# EasyEDA Pro project 电脑鼠_数字量最终方案.eprj, schematic 扩展主板
Create Date: 2025-09-23; Page Name: P1; Project Name: 电脑鼠SYR; Schematic Name: 扩展主板; Update Date: 2025-10-13; Company: 苏州大学电子信息学院; Drawed: 石殷睿; Page Size: A4; Version: V1.0
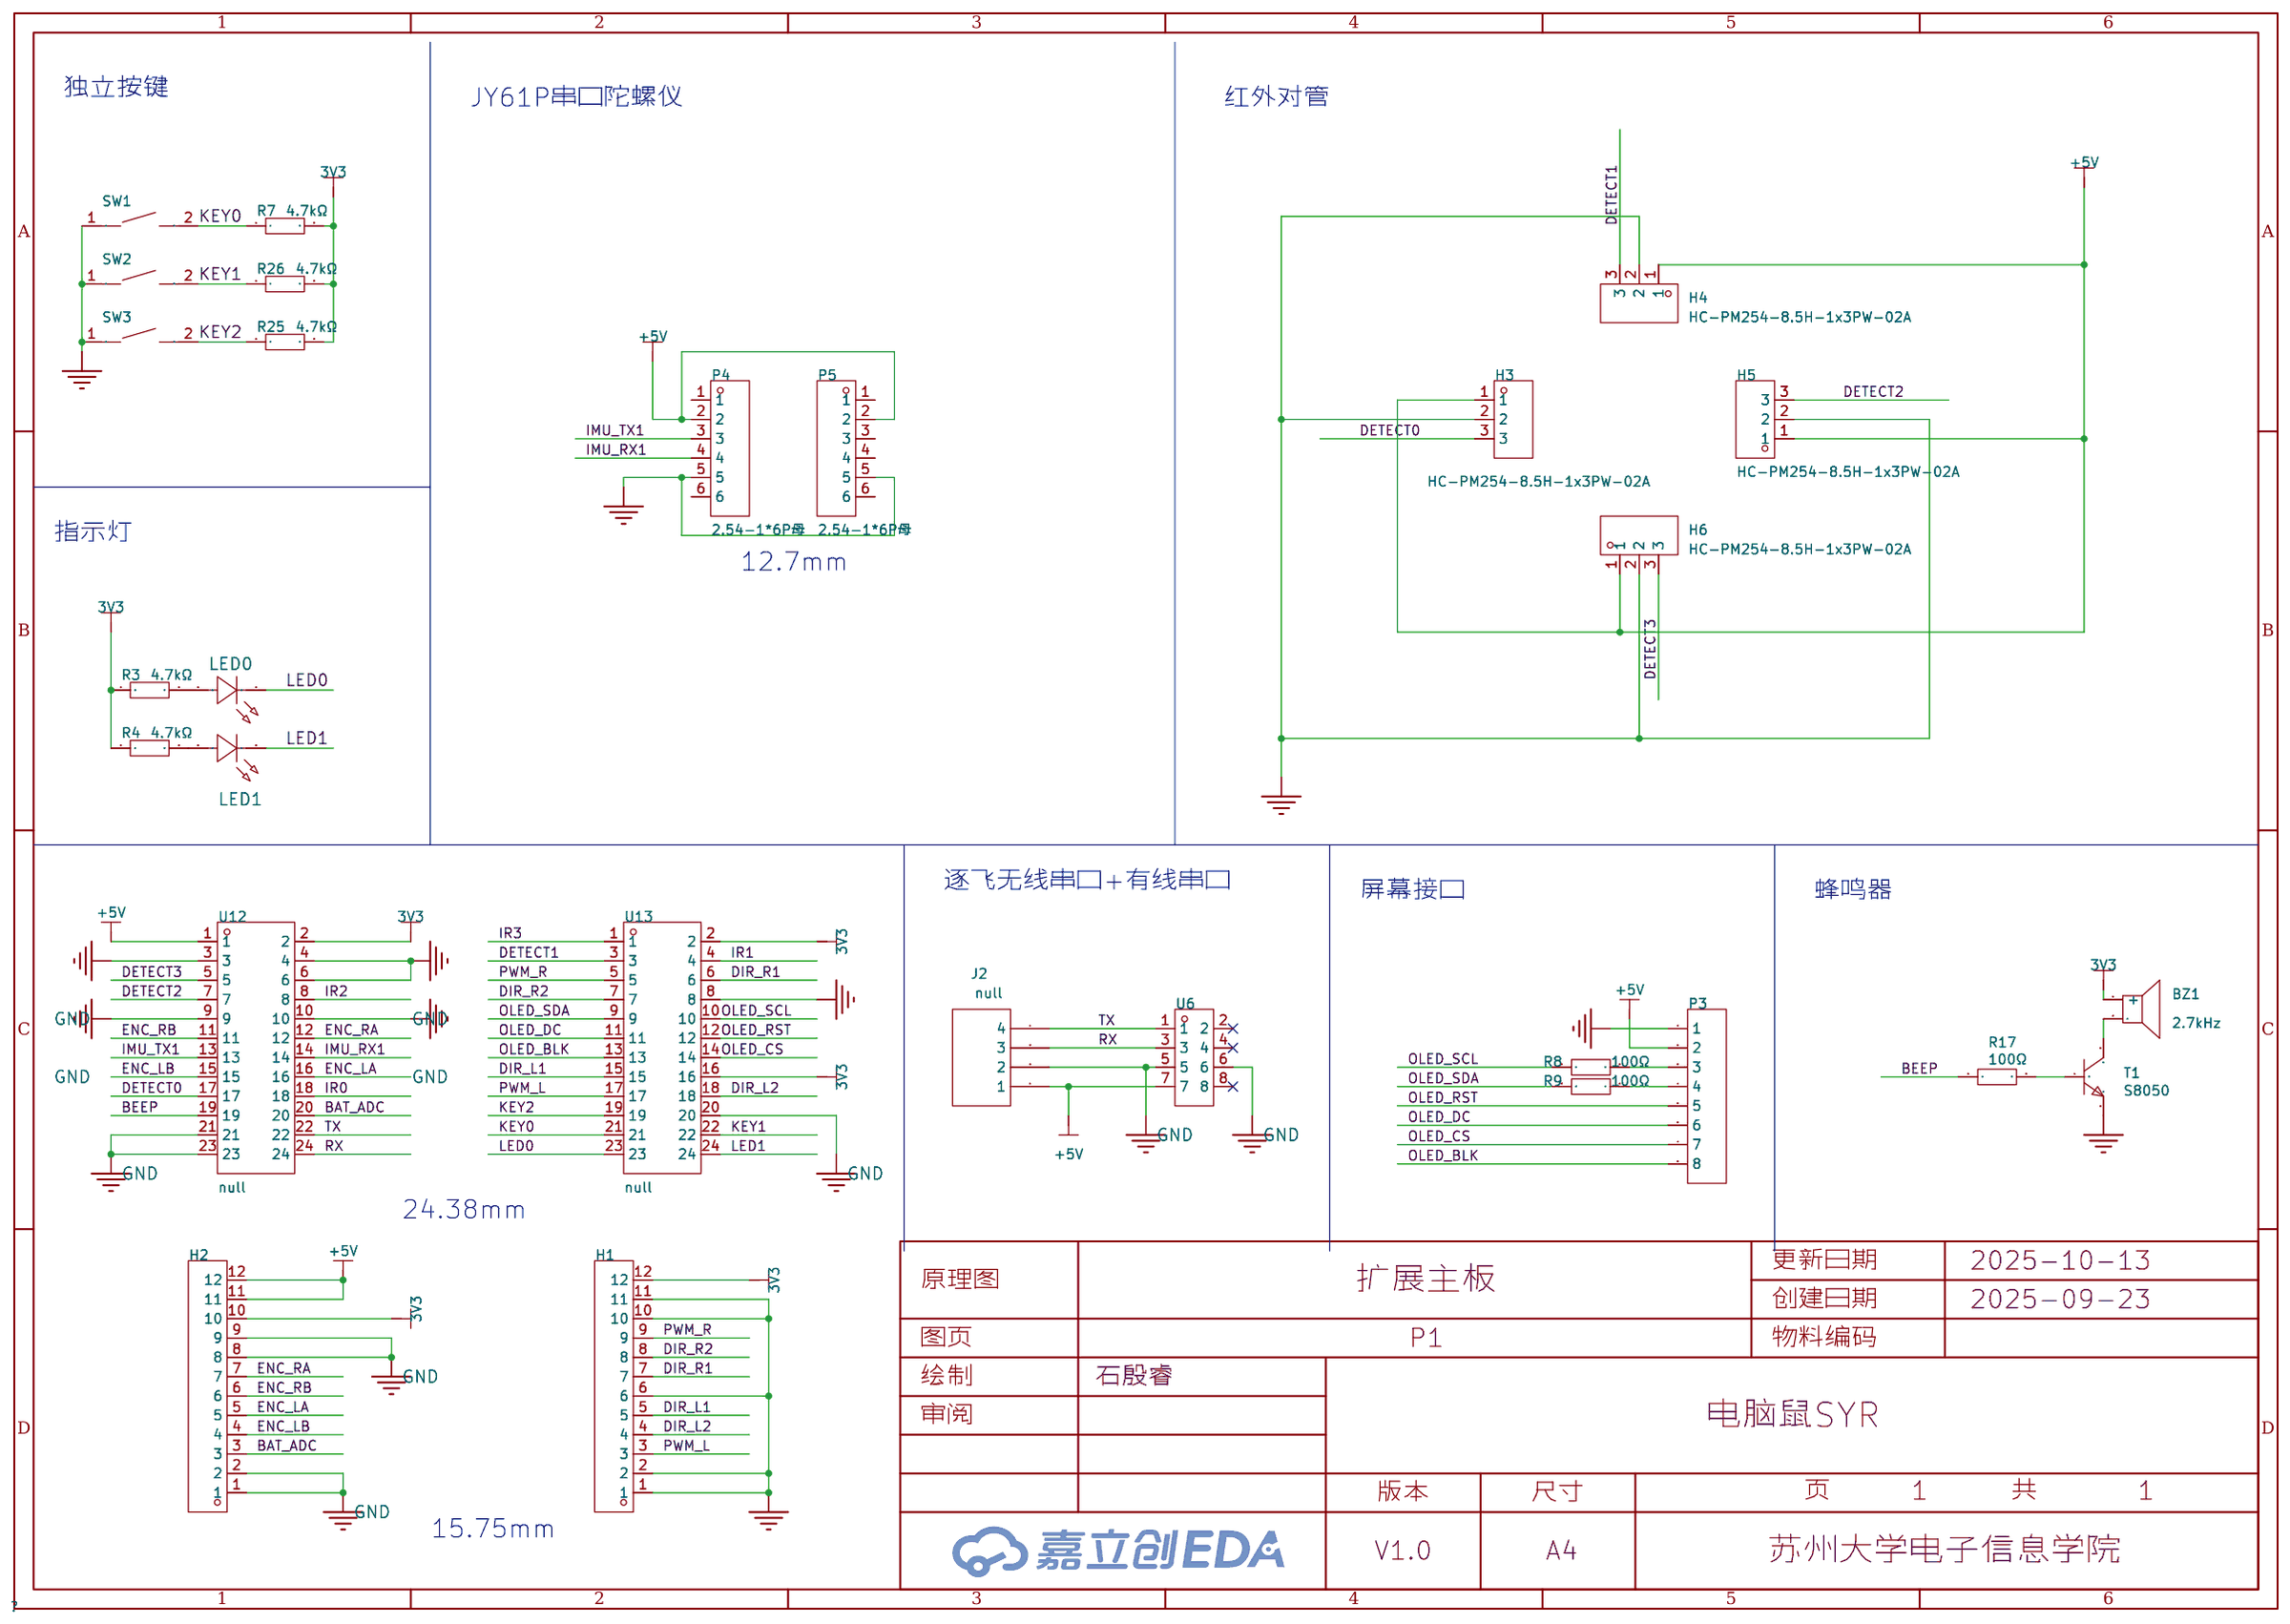
[diagram p0: schematic sheet]

## Parts
BZ1  2.7kHz  [BUZ-TH_BD12.0-P7.60-D0.6-FD]
H1  -  [HDR-TH_12P-P2.54-V-M]
H2  -  [HDR-TH_12P-P2.54-V-M]
H3  HC-PM254-8.5H-1x3PW-02A  [HDR-TH_3P-P2.54_HC-PM254-8.5H-1X3PW]
H4  HC-PM254-8.5H-1x3PW-02A  [HDR-TH_3P-P2.54_HC-PM254-8.5H-1X3PW]
H5  HC-PM254-8.5H-1x3PW-02A  [HDR-TH_3P-P2.54_HC-PM254-8.5H-1X3PW]
H6  HC-PM254-8.5H-1x3PW-02A  [HDR-TH_3P-P2.54_HC-PM254-8.5H-1X3PW]
J2  null  [HEADER1X4]
LED0  XL-1608SURC-06  [LED0603-RD_RED]
LED1  XL-1608SURC-06  [LED0603-RD_RED]
P3  null  [HDR-TH_8P-P2.54-V-F-1]
P4  2.54-1*6P母  [HDR-TH_6P-P2.54-V-F]
P5  2.54-1*6P母  [HDR-TH_6P-P2.54-V-F]
R3  4.7kΩ  [R0603]
R4  4.7kΩ  [R0603]
R7  4.7kΩ  [R0603]
R8  100Ω  [R0603]
R9  100Ω  [R0603]
R17  100Ω  [R0603]
R25  4.7kΩ  [R0603]
R26  4.7kΩ  [R0603]
SW1  TS-1088-AR02016  [SW-SMD_L3.9-W3.0-P4.45]
SW2  TS-1088-AR02016  [SW-SMD_L3.9-W3.0-P4.45]
SW3  TS-1088-AR02016  [SW-SMD_L3.9-W3.0-P4.45]
T1  S8050  [SOT-23-3_L2.9-W1.3-P1.90-LS2.3-BR]
U6  null  [HDR-TH_8P-P2.54-V-F-R2-C4-S2.54-1]
U12  null  [HDR-TH_24P-P2.54-V-F-R2-C12-S2.54-2]
U13  null  [HDR-TH_24P-P2.54-V-F-R2-C12-S2.54-2]

## Library data of the parts
BZ1 = SUN-12095-5VPA7.6: 驱动方式:有源(内含驱动线路);构造类型:电磁式;额定电压:-;频率:2.7kHz;声压(SPL):85dB;; LCSC Part Name: 电磁有源蜂鸣器; Supplier Part: C360615; Manufacturer: S&S(海旭); Supplier Footprint: 插件,D=12mm; JLCPCB Part Class: Extended Part; Datasheet: https://item.szlcsc.com/datasheet/SUN-12095-5VPA7.6/335364.html; Supplier: LCSC; Oscillator Circuit: 有源(内含驱动线路); Technology Type: 电磁式; Operating Voltage: 3V~7V; Sound Pressure Level (SPL): 85dB@5V,10cm; Diameter (φD): 12mm; Height: 9.8mm; Driver Circuitry: 有源(内含驱动线路); Technology: 电磁式; Voltage - Supply: 4V~7V; Sound Pressure Level(SPL): 85dB; Diameter(φD): 12mm
H1 H2 = HDR-M_2.54_1x12P: 间距:2.54mm;总PIN位数:12;排数:1;插针结构:1x12P;行距:-;安装类型:直插;圆针/方针:方针;额定电流:3A;额定电压:250V;配合针长度:6mm;塑高:2.5mm;端接针长度:3mm;触头材质:-;工作温度范围:-40℃~+105℃;颜色:黑色;; Supplier Part: C2840012; Supplier Footprint: 插件; JLCPCB Part Class: 扩展库; Check: false
H3-H6 = HC-PM254-8.5H-1x3PW-02A: 插孔结构:1x3P;间距:2.54mm;行距:-;圆孔/方孔:方孔;安装方式:弯插;排数:单排;总孔位数:3P;额定电流:3A;额定电压:-;插孔方向:侧面;塑高:2.5mm;触头材质:黄铜;触头镀层:金;工作温度:-40℃~+105℃;; LCSC Part Name: 间距2.54mm 1x3Pin 弯插 PC3.2 PB10.2 H8.5; Supplier Part: C22373927; Manufacturer: HC(虹成电子); Supplier Footprint: 弯插,P=2.54mm; JLCPCB Part Class: 扩展库; Datasheet: https://item.szlcsc.com/datasheet/HC-PM254-8.5H-1x3PW-02A/23870263.html; Supplier: LCSC; Holes Structure: 1x3P; Pitch: 2.54mm; Circular Hole / Square Hole: 方孔; Mounting Type: 弯插; Number of Rows: 单排; Number of Positions: 3P; Current Rating: 3A; Holes Direction: 侧面; Insulation Height: 2.5mm; Contact Material: 黄铜; Contact Plating: 金; Operating Temperature: -40℃~+105℃; PIN Length: 3mm
J2 = Header1x4: Check: false
LED0 LED1 = XL-1608SURC-06: 灯头类型:-;发光颜色:红色;正向压降(Vf):2.3V;功率:50mW;正向电流:20mA;波长:620nm~630nm;二极管配置:-;透镜颜色:无色透明透镜;色温:-;发光强度:225mcd;发光角度:120°;载带方式:正贴;工作温度:-40℃~+85℃;; LCSC Part Name: 0603红色贴片式发光二极管; Supplier Part: C965799; Manufacturer: XINGLIGHT(成兴光); Supplier Footprint: 0603; JLCPCB Part Class: Extended Part; Datasheet: https://item.szlcsc.com/datasheet/XL-1608SURC-06/1051408.html; Supplier: LCSC; Emitted Color: 红色; Power Dissipation: 55mW; Forward Current: 20mA; Dominant Wavelength: 617nm~621nm; Peak Wavelength: 625nm; Lens Color: 无色透明透镜; Viewing Angle: 120°; Mounting Sytle: 正贴; Operating Temperature: -40℃~+85℃; Illumination Color: 红色; Voltage - Forward(Vf): 2.3V; Power(Watts): 50mW; Wavelength - Dominant: 620nm~630nm; Luminous Intensity: 225mcd; Mounting Style: 正贴
P3 = 2.54-1*8P母环保: 插孔结构:1x8P;间距:2.54mm;行距:-;安装类型:直插;排数:单排;总孔位数:8P;塑高:-;触头材质:-;触头镀层:-;; LCSC Part Name: 间距:2.54mm 1x8P 直插; Supplier Part: C27438; Manufacturer: BOOMELE(博穆精密); Supplier Footprint: 插件,P=2.54mm; JLCPCB Part Class: 扩展库; Datasheet: https://atta.szlcsc.com/upload/public/pdf/source/20231221/1CA800C6799ED97958773716FAA1BFFE.pdf; Supplier: LCSC; Holes Structure: 1x8P; Pitch: 2.54mm; Mounting Type: 直插; Number of Rows: 单排; Number of Holes: 8P; Check: false
P4 P5 = 2.54-1*6P母: 插孔结构:1x6P;间距:2.54mm;行距:-;安装方式:直插;排数:单排;总孔位数:6P;塑高:-;触头材质:-;触头镀层:-;; LCSC Part Name: 间距:2.54mm 1x6P 直插; Supplier Part: C40877; Manufacturer: BOOMELE(博穆精密); Supplier Footprint: 插件,P=2.54mm; JLCPCB Part Class: 扩展库; Datasheet: https://item.szlcsc.com/datasheet/2.54-1*6P%25E6%25AF%258D/41861.html; Supplier: LCSC; Holes Structure: 1x6P; Pitch: 2.54mm; Mounting Type: 直插; Number of Rows: 单排; Number of Positions: 6P
R3 R4 R7 R25 R26 = 0603WAF4701T5E: 电阻类型:厚膜电阻;阻值:4.7kΩ;精度:±1%;功率:100mW;工作电压:75V;温度系数:±100ppm/℃;; LCSC Part Name: 4.7kΩ ±1% 100mW 厚膜电阻; Supplier Part: C23162; Manufacturer: UNI-ROYAL(厚声); Supplier Footprint: 0603; JLCPCB Part Class: Basic Part; Datasheet: https://item.szlcsc.com/datasheet/0603WAF4701T5E/23889.html; Supplier: LCSC; Type: 厚膜电阻; Tolerance: ±1%; Power(Watts): 100mW; Overload Voltage (Max): 75V; Temperature Coefficient: ±100ppm/℃; Operating Temperature Range: -55℃~+155℃; Voltage-Supply(Max): 75V; Operating Temperature: -55℃~+155℃
R8 R9 R17 = 0603WAF1000T5E: 电阻类型:厚膜电阻;阻值:100Ω;精度:±1%;功率:100mW;最大工作电压:75V;温度系数:±200ppm/℃;; LCSC Part Name: 100Ω ±1% 100mW 厚膜电阻; Supplier Part: C22775; Manufacturer: UNI-ROYAL(厚声); Supplier Footprint: 0603; JLCPCB Part Class: Basic Part; Datasheet: https://atta.szlcsc.com/upload/public/pdf/source/20200306/C422600_1E6D84923E4A46A82E41ADD87F860B5C.pdf; Supplier: LCSC; Type: 厚膜电阻; Tolerance: ±1%; Power(Watts): 100mW; Overload Voltage (Max): 75V; Temperature Coefficient: ±200ppm/℃; Operating Temperature Range: -55℃~+155℃
SW1-SW3 = TS-1088-AR02016: 电路结构:单刀单掷;按钮形状:圆形按钮;作用力:1.6N;安装方式:立贴;开关长度:4mm;开关宽度:3mm;开关高度:2mm;带支架:不带支架;触点电流:50mA;额定电压:12V;工作寿命:10万次;; LCSC Part Name: 4*3*2mm 立贴 轻触开关; Supplier Part: C720477; Manufacturer: XUNPU(讯普); Supplier Footprint: SMD; JLCPCB Part Class: Basic Part; Datasheet: https://item.szlcsc.com/datasheet/TS-1088-AR02016/763484.html; Supplier: LCSC; Circuit: 单刀单掷; Actuator Style: 圆形按钮; Operating Force: 1.6N; Mounting Type: 立贴; Length: 4mm; Width: 3mm; Switch Height: 2mm; with Bracket: 不带支架; Contact Current: 50mA; Voltage Rating: 12V; Actuator/Cap Color: 黑色; Termination Style: SMD接片; Life: 10万次; Operating Temperature: -30℃~+80℃; link: https://so.szlcsc.com/global.html?k=C720477&amp;ref=editor
T1 = S8050_C20069125: 晶体管类型:NPN;集电极电流(Ic):500mA;集射极击穿电压(Vceo):25V;耗散功率(Pd):300mW;直流电流增益(hFE):120@50mA,1.0V;; LCSC Part Name: hFE:200-350，丝印:J3Y S8050; Supplier Part: C20069125; Manufacturer: R+O(宏嘉诚); Supplier Footprint: SOT-23; JLCPCB Part Class: Extended Part; Datasheet: https://item.szlcsc.com/datasheet/S8050/21397163.html; Supplier: LCSC; Transistor Type: NPN; Collector Current (Ic): 500mA; Collector-Emitter Breakdown Voltage (Vceo): 25V; Power Dissipation (Pd): 300mW; DC Current Gain (hFE@Ic,Vce): 120@50mA,1.0V; Transition Frequency (fT): 100MHz; Collector Cut-Off Current (Icbo): 100nA; Collector-Emitter Saturation Voltage (VCE(sat)@Ic,Ib): 600mV@500mA,50mA; Operating Temperature: -55℃~+150℃; type: NPN; Current - Collector(Ic): 500mA; Collector - Emitter Voltage VCEO: 25V; Pd - Power Dissipation: 300mW; DC Current Gain: 120@50mA,1.0V; Transition frequency(fT): 100MHz; Current - Collector Cutoff: 100nA; Vce Saturation(VCE(sat)): 600mV@500mA,50mA; Emitter-Base Voltage(Vebo): 5V
U6 = 2.54mm,2×4Doublerowfemale: Supplier Part: C9900004313; JLCPCB Part Class: 扩展库; Supplier: LCSC; Check: false
U12 U13 = X6521FV-2x12-C85D32: 插孔结构:2x12P;间距:2.54mm;行距:2.54mm;圆孔/方孔:方孔;安装类型:直插;排数:双排;总孔位数:24P;额定电流:3A;额定电压:250V;插孔方向:顶部;塑高:8.5mm;触头材质:黄铜;触头镀层:金;工作温度范围:-40℃~+105℃;焊接温度(最大值):260℃;; LCSC Part Name: 间距:2.54mm 2x12P 直插; Supplier Part: C2883985; Manufacturer: XKB Connectivity(中国星坤); Supplier Footprint: 插件,P=2.54mm; JLCPCB Part Class: 扩展库; Datasheet: https://atta.szlcsc.com/upload/public/pdf/source/20211009/C636DBF0733662F7F428F4420CCBBD46.pdf; Supplier: LCSC; Holes Structure: 2x12P; Pitch: 2.54mm; Row Spacing: 2.54mm; Circular Hole / Square Hole: 方孔; Mounting Type: 直插; Number of Rows: 双排; Number of Holes: 24P; Current Rating (Max): 3A; Voltage Rating (Max): 250V; Holes Direction: 顶部; Insulation Height: 8.5mm; Contact Material: 黄铜; Contact Plating: 金; Operating Temperature Range: -40℃~+105℃; Soldering Temperature(Max): 260℃; Check: false

## Nets
3V3: BZ1.1(+) H1.12 H2.10 R3.1 R4.1 R7.2 R25.2 R26.2 U12.2 U13.2 U13.16
+5V: H2.11 H2.12 H3.1 H4.1 H5.1 H6.1 J2.1 P3.2 P4.2 P5.2 U6.7 U12.1
GND: H1.1 H1.2 H1.6 H1.10 H1.11 H2.1 H2.2 H2.8 H2.9 H3.2 H4.2 H5.2 H6.2 J2.2 P3.1 P4.5 P5.5 SW1.1 SW2.1 SW3.1 T1.2(E) U6.5 U6.6 U12.3 U12.4 U12.6 U12.9 U12.10 U12.21 U12.23 U13.8 U13.20
BAT_ADC: H2.3 U12.20
BEEP: R17.1 U12.19
DETECT0: H3.3 U12.17
DETECT1: H4.3 U13.3
DETECT2: H5.3 U12.7
DETECT3: H6.3 U12.5
DIR_L1: H1.5 U13.15
DIR_L2: H1.4 U13.18
DIR_R1: H1.7 U13.6
DIR_R2: H1.8 U13.7
ENC_LA: H2.5 U12.16
ENC_LB: H2.4 U12.15
ENC_RA: H2.7 U12.12
ENC_RB: H2.6 U12.11
IMU_RX1: P4.4 U12.14
IMU_TX1: P4.3 U12.13
IR0: U12.18
IR1: U13.4
IR2: U12.8
IR3: U13.1
KEY0: R7.1 SW1.2 U13.21
KEY1: R26.1 SW2.2 U13.22
KEY2: R25.1 SW3.2 U13.19
LED0: LED0.1(K) U13.23
LED1: LED1.1(K) U13.24
OLED_BLK: P3.8 U13.13
OLED_CS: P3.7 U13.14
OLED_DC: P3.6 U13.11
OLED_RST: P3.5 U13.12
OLED_SCL: R8.2 U13.10
OLED_SDA: R9.2 U13.9
PWM_L: H1.3 U13.17
PWM_R: H1.9 U13.5
RX: J2.3 U6.3 U12.24
TX: J2.4 U6.1 U12.22
$1N2633: R17.2 T1.1(B)
$1N2636: BZ1.2 T1.3(C)
$1N2649: P3.3 R8.1
$1N2650: P3.4 R9.1
$1N2827: LED0.2(A) R3.2
$1N2828: LED1.2(A) R4.2

Not connected (* = marked no-connect by the designer): P4 1 6; P5 1 3 4 6; U6 2* 4* 8*

## Notes on the sheet
- 独立按键
- JY61P串口陀螺仪
- 红外对管
- 指示灯
- 12.7mm
- 逐飞无线串口+有线串口
- 屏幕接口
- 蜂鸣器
- 24.38mm
- 15.75mm
